# EAGLE design sym1_inverter (EAGLE 9.6.2)
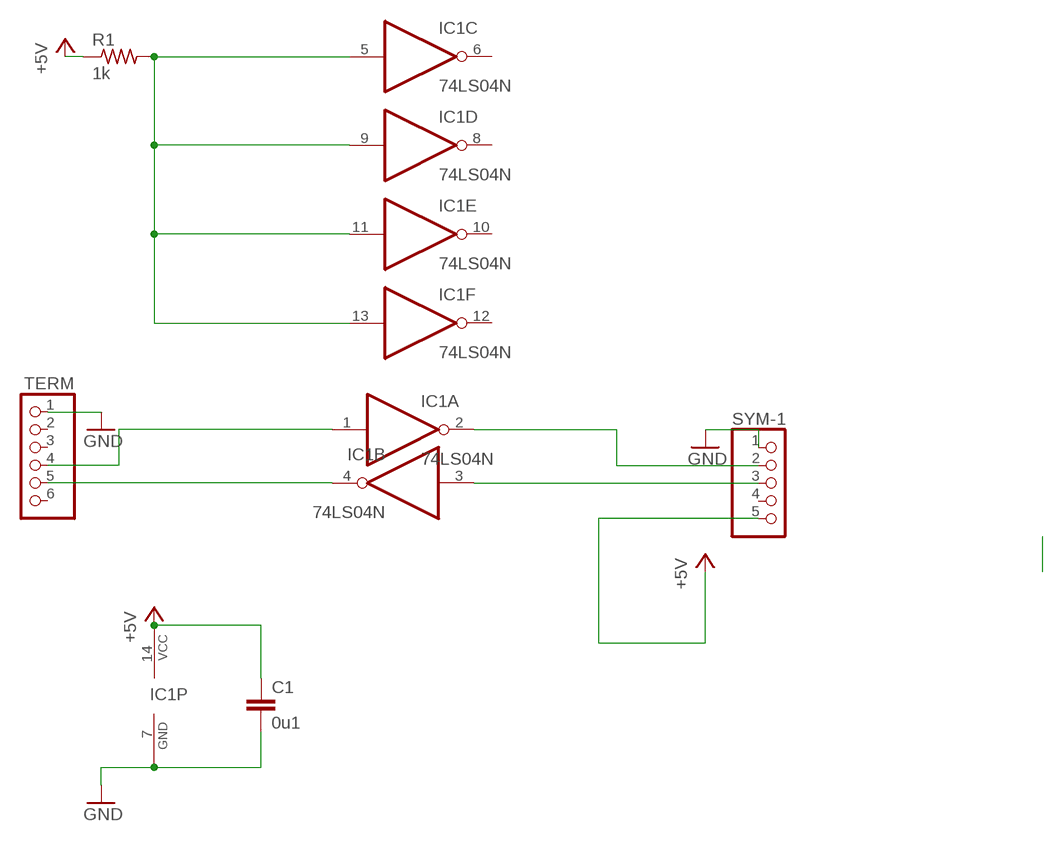
[diagram p0: schematic, sheet 1]

## Parts
C1  0u1  C-EU050-025X075-AARON  [C050-025X075-AARON]
IC1  74LS04N  [DIL14]
R1  1k  R-US_0207/10  [0207/10]
SYM-1  PINHD-1X5  [1X05]
TERM  PINHD-1X6  [1X06]

## Nets
+5V: C1.1 IC1.14(P:VCC) R1.1 SYM-1.5
GND: C1.2 IC1.7(P:GND) SYM-1.1 TERM.1
N$1: IC1.2(A:O) SYM-1.2
N$2: IC1.3(B:I) SYM-1.3
N$3: IC1.4(B:O) TERM.5
N$4: IC1.1(A:I) TERM.4
N$5: IC1.5(C:I) IC1.9(D:I) IC1.11(E:I) IC1.13(F:I) R1.2
Unconnected: IC1.6(C:O) IC1.8(D:O) IC1.10(E:O) IC1.12(F:O) SYM-1.4 TERM.2 TERM.3 TERM.6

## Library data of the parts
C1 = aaroncaps:C-EU: CAPACITOR, European symbol
IC1 = 74xx-us:74*04: Hex INVERTER
R1 = rcl:R-US_: RESISTOR, American symbol; SPICEPREFIX: R
SYM-1 = pinhead:PINHD-1X5: PIN HEADER
TERM = adafruit:PINHD-1X6: PIN HEADER

## Board
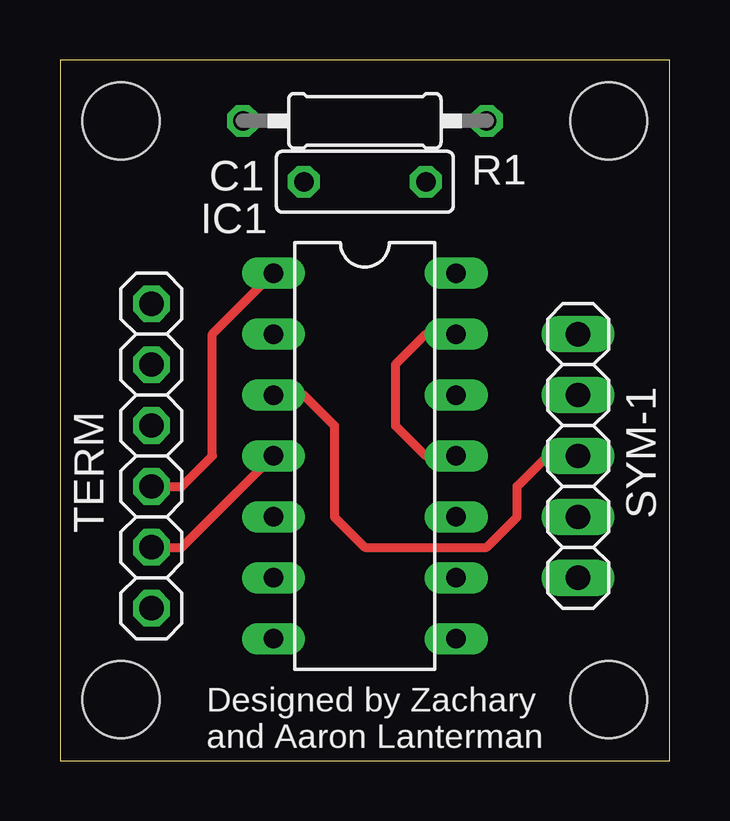
[diagram p1: board, top side]
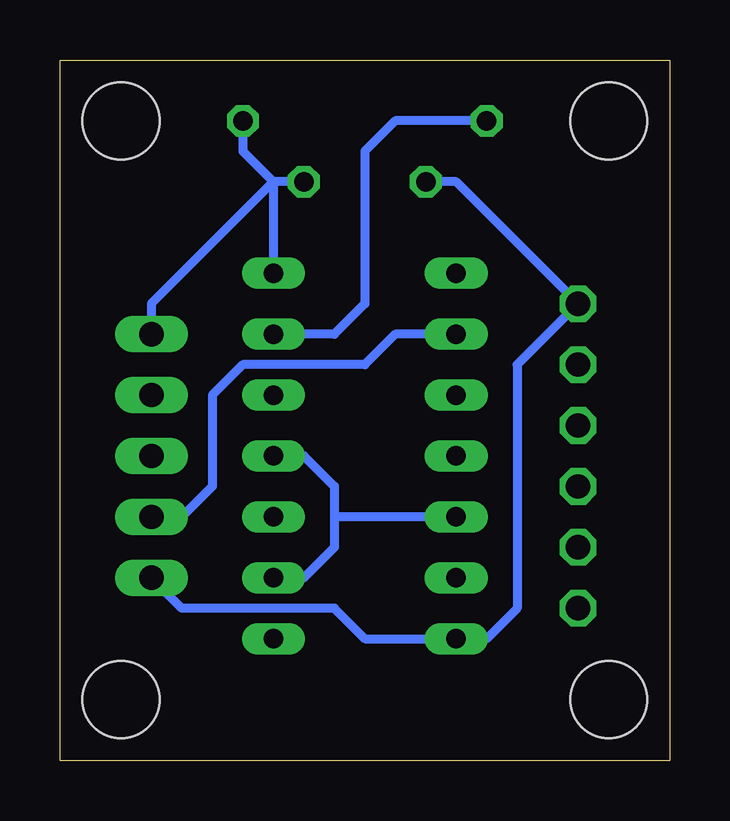
[diagram p2: board, bottom side, seen from below]

Size 25.4 x 29.21 mm. Coordinates in mm from the lower left corner, seen from the top.
Outline: 0,0 25.4,0 25.4,29.21 0,29.21 0,0
Copper layers (1*16): Top 0.035mm / dielectric 1.5mm / Bottom 0.035mm
Design rules "default": minimum track width 6mil, minimum drill 0.35mm, track to track 6mil, track to pad 6mil, pad to pad 6mil, via to via 6mil, smd to smd 6mil, copper to edge 40mil, drill to drill 6mil, minimum pad ring 10mil, minimum via ring 8mil, stop-mask expansion 4mil, vias tented up to drill 0mil, thermal gap 10mil
Holes 3.2 mm at 2.54,2.54 2.54,26.67 22.86,2.54 22.86,26.67

### Footprints (pad centres in the part's own frame; a part is rotated, then mirrored left to right if it is on the bottom)
C050-025X075-AARON = drill 0.813 octagon: 1 -2.54,0; 2 2.54,0
DIL14 = drill 0.813 long: 1 -7.62,-3.81; 2 -5.08,-3.81; 3 -2.54,-3.81; 4 0,-3.81; 5 2.54,-3.81; 6 5.08,-3.81; 7 7.62,-3.81; 8 7.62,3.81; 9 5.08,3.81; 10 2.54,3.81; 11 0,3.81; 12 -2.54,3.81; 13 -5.08,3.81; 14 -7.62,3.81
0207/10 = drill 0.813 octagon: 1 -5.08,0; 2 5.08,0
1X05 = drill 1.016 long: 1 -5.08,0; 2 -2.54,0; 3 0,0; 4 2.54,0; 5 5.08,0
1X06 = drill 1.016 octagon: 1 -6.35,0; 2 -3.81,0; 3 -1.27,0; 4 1.27,0; 5 3.81,0; 6 6.35,0

### Placement (x,y rotation side)
C1  12.7,24.13 180 top
IC1  12.7,12.7 270 top
R1  12.7,26.67 180 top
SYM-1  21.59,12.7 90 top
TERM  3.81,12.7 270 top

### Tracks (layer width: path | path; a pad name or v marks a point on that pad's centre or on a via)
+5V
  Bottom 0.381: C1.1 16.51,24.13 | 16.51,24.13 21.59,19.05 SYM-1.5 | 16.51,24.13 IC1.14 | R1.1 17.78,25.4 16.51,24.13
GND
  Bottom 0.381: C1.2 8.89,24.13 TERM.1 6.35,16.51 6.35,6.35 7.62,5.08 IC1.7 12.7,5.08 13.97,6.35 20.32,6.35 SYM-1.1
N$1
  Bottom 0.381: IC1.2 11.43,17.78 12.7,16.51 17.78,16.51 19.05,15.24 19.05,11.43 20.32,10.16 SYM-1.2
N$2
  Top 0.381: IC1.3 10.16,15.24 11.43,13.97 11.43,10.16 12.7,8.89 17.78,8.89 19.05,10.16 19.05,11.43 20.32,12.7 SYM-1.3
N$3
  Top 0.381: TERM.5 5.08,8.89 IC1.4
N$4
  Top 0.381: IC1.1 6.35,17.78 6.35,12.7 5.08,11.43 TERM.4
N$5
  Top 0.381: IC1.13 15.24,17.78 13.97,16.51 13.97,13.97 15.24,12.7 IC1.11
  Bottom 0.381: R1.2 11.43,26.67 12.7,25.4 12.7,19.05 13.97,17.78 IC1.13 | IC1.11 15.24,12.7 13.97,11.43 13.97,10.16 | IC1.9 15.24,7.62 13.97,8.89 13.97,10.16 | IC1.5 13.97,10.16

### Text on the board
tNames: Designed by Zachary / and Aaron Lanterman